# Altium schematic sheet smart_safety-schematic.SchDoc: SAFETY BOX VER 1
size A4; Engineer: SevKan; Revision: 1; SheetNumber: 1; SheetTotal: 1
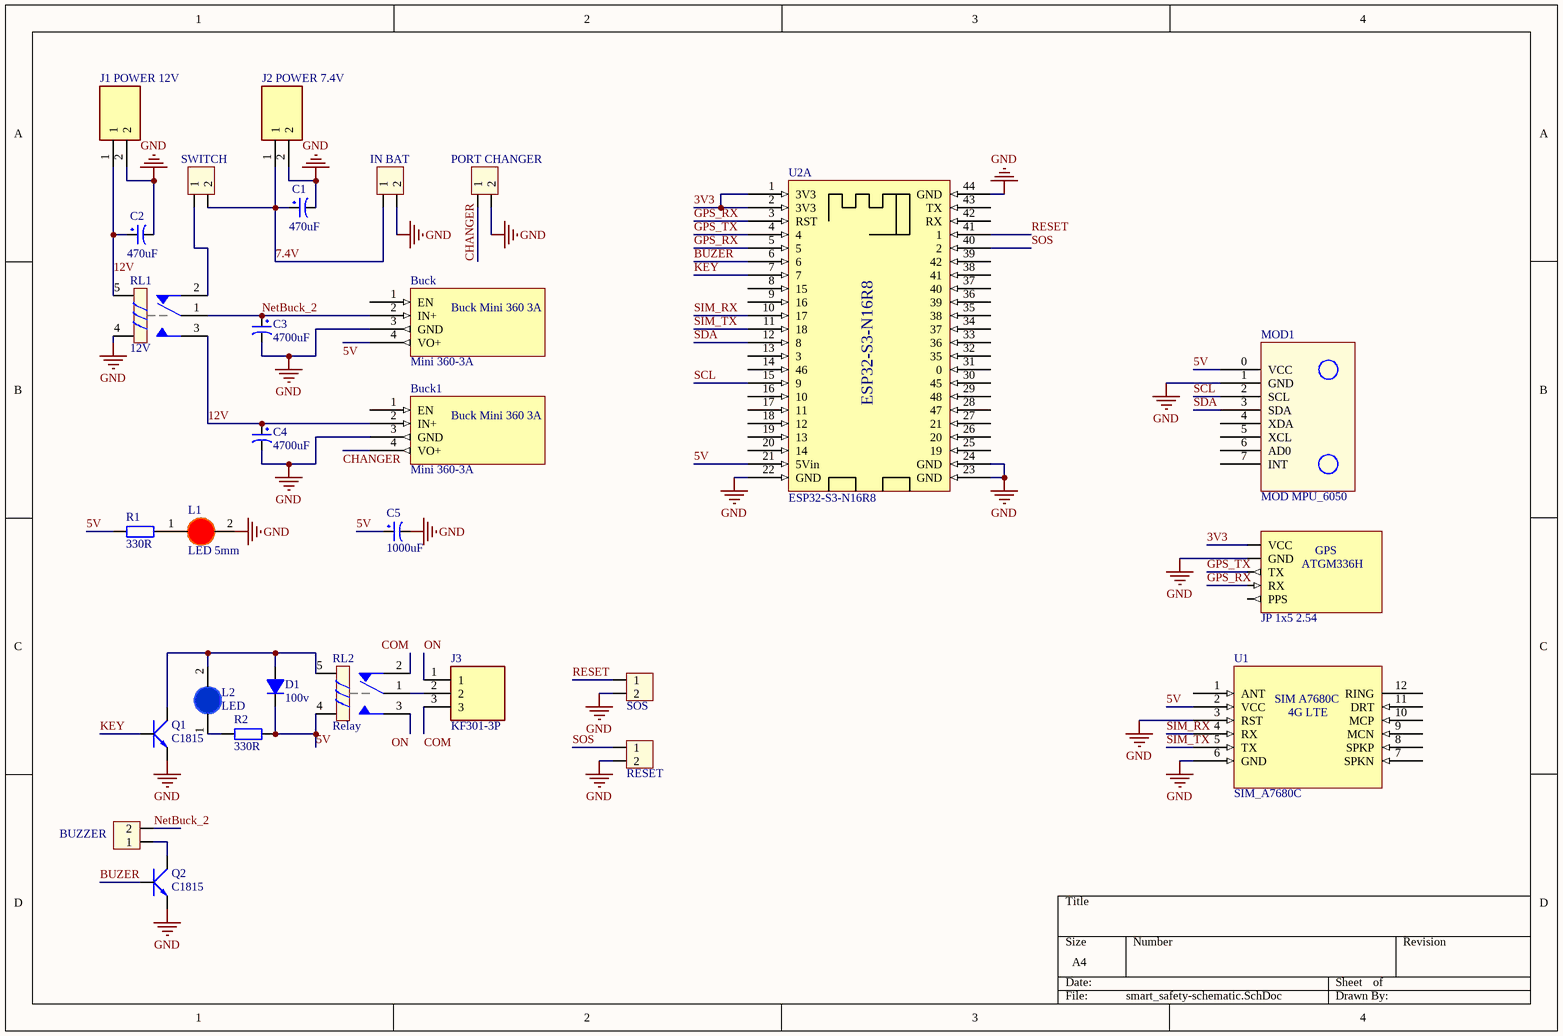
[diagram p0: smart_safety-schematic.SchDoc]

## Parts
Buck  Mini 360-3A  [PCBComponent_1]
Buck1  Mini 360-3A  [PCBComponent_1]
C1  470uF  [tu hoa 8mm]
C2  470uF  [tu hoa 8mm]
C3  4700uF  [tu hoa 16mm]
C4  4700uF  [tu hoa 16mm]
C5  1000uF  [tu hoa 8mm]
D1  100v  [DIODE 1A]
H1  SWITCH  [XH2.54M-2]
H2  IN BAT  [XH2.54M-2]
H3  PORT CHANGER  [XH2.54M-2]
H4  SOS  [XH2.54M-2]
H5  RESET  [XH2.54M-2]
H6  BUZZER  [XH2.54M-2]
J1  POWER 12V  [KF3012P]
J2  POWER 7.4V  [KF3012P]
J3  KF301-3P  [KF3013P]
L1  LED 5mm  [LED-5MM-RED]
L2  LED  [LED-5MM-BLUE]
MOD1  MOD MPU_6050  [MOD MPU-6050]
Q1  C1815  [TO92]
Q2  C1815  [TO92]
R1  330R  [tro vach 1/4w]
R2  330R  [tro vach 1/4w]
RL1  12V  [Relay 5 Chan SRD]
RL2  Relay  [Relay 5 Chan SRD]
U  JP 1x5 2.54  [GPS_ATMG336H]
U1  SIM_A7680C  [SIMCOM_A7680C]
U2  ESP32-S3-N16R8  [ESP32-S3-N16R8]  (part A of 4)

## Nets
GND: Buck.3(GND) Buck1.3(GND) C1.2 C2.2 C3.2 C4.2 C5.2 H2.2 H3.2 H4.2 H5.2 J1.2 J2.2 L1.2(K) MOD1.1(GND) Q1.1(E) Q2.1(E) RL1.4 U.2(GND) U1.3(RST) U1.6(GND) U2.22(GND) U2.23(GND) U2.24(GND) U2.44(GND)
3V3: U.1(VCC) U2.1(3V3) U2.2(3V3)
5V: Buck.4(VO+) C5.1 D1.2(K) MOD1.0(VCC) R1.1 R2.2 RL2.4 U1.2(VCC) U2.21(5Vin)
7.4V: C1.1 H1.2 H2.1 J2.1
12V: Buck1.2(IN+) C2.1 C4.1 J1.1 RL1.3 RL1.5
BUZER: Q2.3(B) U2.6
CHANGER: Buck1.4(VO+) H3.1
COM: J3.3 RL2.2
GPS_RX: U.4(RX) U2.3(RST) U2.5
GPS_TX: U.3(TX) U2.4
KEY: Q1.3(B) U2.7
NetBuck_2: Buck.2(IN+) C3.1 H6.2 RL1.1
ON: J3.1 RL2.3
RESET: H4.1 U2.41(1)
SCL: MOD1.2(SCL) U2.15(9)
SDA: MOD1.3(SDA) U2.12(8)
SIM_RX: U1.4(RX) U2.10(17)
SIM_TX: U1.5(TX) U2.11(18)
SOS: H5.1 U2.40(2)
NetD1_1: D1.1(A) L2.2(K) Q1.2(C) RL2.5
NetH1_1: H1.1 RL1.2
NetH6_1: H6.1 Q2.2(C)
NetJ3_2: J3.2 RL2.1
NetL1_1: L1.1(A) R1.2
NetL2_1: L2.1(A) R2.1

Not connected (* = marked no-connect by the designer): Buck 1(EN); Buck1 1(EN); MOD1 4(XDA) 5(XCL) 6(AD0) 7(INT); U 5(PPS); U1 1(ANT) 7(SPKN) 8(SPKP) 9(MCN) 10(MCP) 11(DRT) 12(RING); U2 8(15) 9(16) 13(3) 14(46) 16(10) 17(11) 18(12) 19(13) 20(14) 25(19) 26(20) 27(21) 28(47) 29(48) 30(45) 31(0) 32(35) 33(36) 34(37) 35(38) 36(39) 37(40) 38(41) 39(42) 42(RX) 43(TX)

## Notes on the sheet
- (in symbol GPS_ATGM336H) GPS; ATGM336H
- (in symbol Mini 360-3A) Buck Mini 360 3A
- (in symbol SIM_A7680C) SIM A7680C; 4G LTE

## Library data of the parts
Buck = Mini 360-3A: 5v for system
Buck1 = Mini 360-3A: 5V for changing
C1 C2 = Tu Hoa 470uF 16V 8x11: Cắm; Don_Vi: Con; So_Chan: 2; Ten_Linh_Kien: Tụ Hóa 470uF 16V 8x11MM; Ma_Hang: MH006550; Chung_Loai: Cắm; Kieu_Chan: *
C3 C4 = Tu Hoa 4700uF 25V 16x25: Cắm; Don_Vi: Con; So_Chan: 2; Ten_Linh_Kien: Tụ Hóa 4700uF 25V 16x25MM; Ma_Hang: MH004426; Chung_Loai: Cắm; Kieu_Chan: *
C5 = Tu Hoa 1000uF 16V 8x20: Cắm; Don_Vi: Con; So_Chan: 2; Ten_Linh_Kien: Tụ Hóa 1000uF 16V 8x20MM; Ma_Hang: MH008300; Chung_Loai: Cắm; Kieu_Chan: *
D1 = Diode 1N4007: Cắm; Ten_Linh_Kien: Diode 1N4007 1A (DIP); Don_Vi: Con; Ma_Hang: MH001063; Ghi Chu: *; Kieu_Chan: *; Chung_Loai: Cắm
H1-H6 = Header 2P 2.54 Duc Thang: Cắm; Ten_Linh_Kien: Header 2P XH2.54-2P Đực Thẳng; Don_Vi: Con; Ma_Hang: MH001283; Chung_Loai: Cắm
J1 J2 = KF301-2P: Terminal Block 5mm Pitch 2 poles; Manufacturer_Name: Handson Technology; Geometry.Height: 10mm; Manufacturer_Part_Number: KF301-2P; Mouser Part Number: *; Mouser Price/Stock: *; Arrow Part Number: *; Arrow Price/Stock: *; Datasheet Link: http://www.handsontec.com/dataspecs/terminal%20block-5mm.pdf
J3 = KF301-3P: Terminal Block 5mm Pitch 3 Poles; Manufacturer_Name: Handson Technology; Geometry.Height: 10mm; Manufacturer_Part_Number: KF301-3P; Mouser Part Number: *; Mouser Price/Stock: *; Arrow Part Number: *; Arrow Price/Stock: *; Datasheet Link: http://www.handsontec.com/dataspecs/terminal%20block-5mm.pdf
L1 = LED 5mm Do: Cắm; Don_Vi: Con; Ma_Hang: MH008967; Ten_Linh_Kien: Led 5MM Phủ Đỏ (1000c); Ghi_Chu: *; Kieu_Chan: *; Chung_Loai: Cắm
L2 = LED 5mm Xanh Duong: Cắm; Don_Vi: Con; Ma_Hang: MH008987; Ten_Linh_Kien: Led 5MM Xanh Dương Đục (1000c); Ghi_Chu: *; Kieu_Chan: *; Chung_Loai: Cắm
Q1 Q2 = Trans C1815 DIP: NPN transistor; Value: C9014
R1 R2 = Tro Vach 1/4W 1% 330R: Cắm; Don_Vi: Con; So_Chan: 2; Ten_Linh_Kien: Trở Vạch 1/4w 1% 330R; Ma_Hang: MH006348; Chung_Loai: Cắm; Kieu_Chan: *
RL1 RL2 = Relay 5 Chan SRD: Relay 5 Chan; Ma_Hang: MH009374; Ten: Relay 5V10A SRD-05VDC-SL-C Chính Hãng
U = GPS_ATGM336H: Ten_Linh_Kien: Jump Đơn Cái 2.54MM 1x20P Thẳng; Don_Vi: Con; Chung_Loai: Cắm; Ghi_Chu: *; Kieu_Chan: *
U2 = ESP32-S3-N16R8: ESP32-S3-DEVKITC-1